# Altium project fmu_f405.PrjPcb
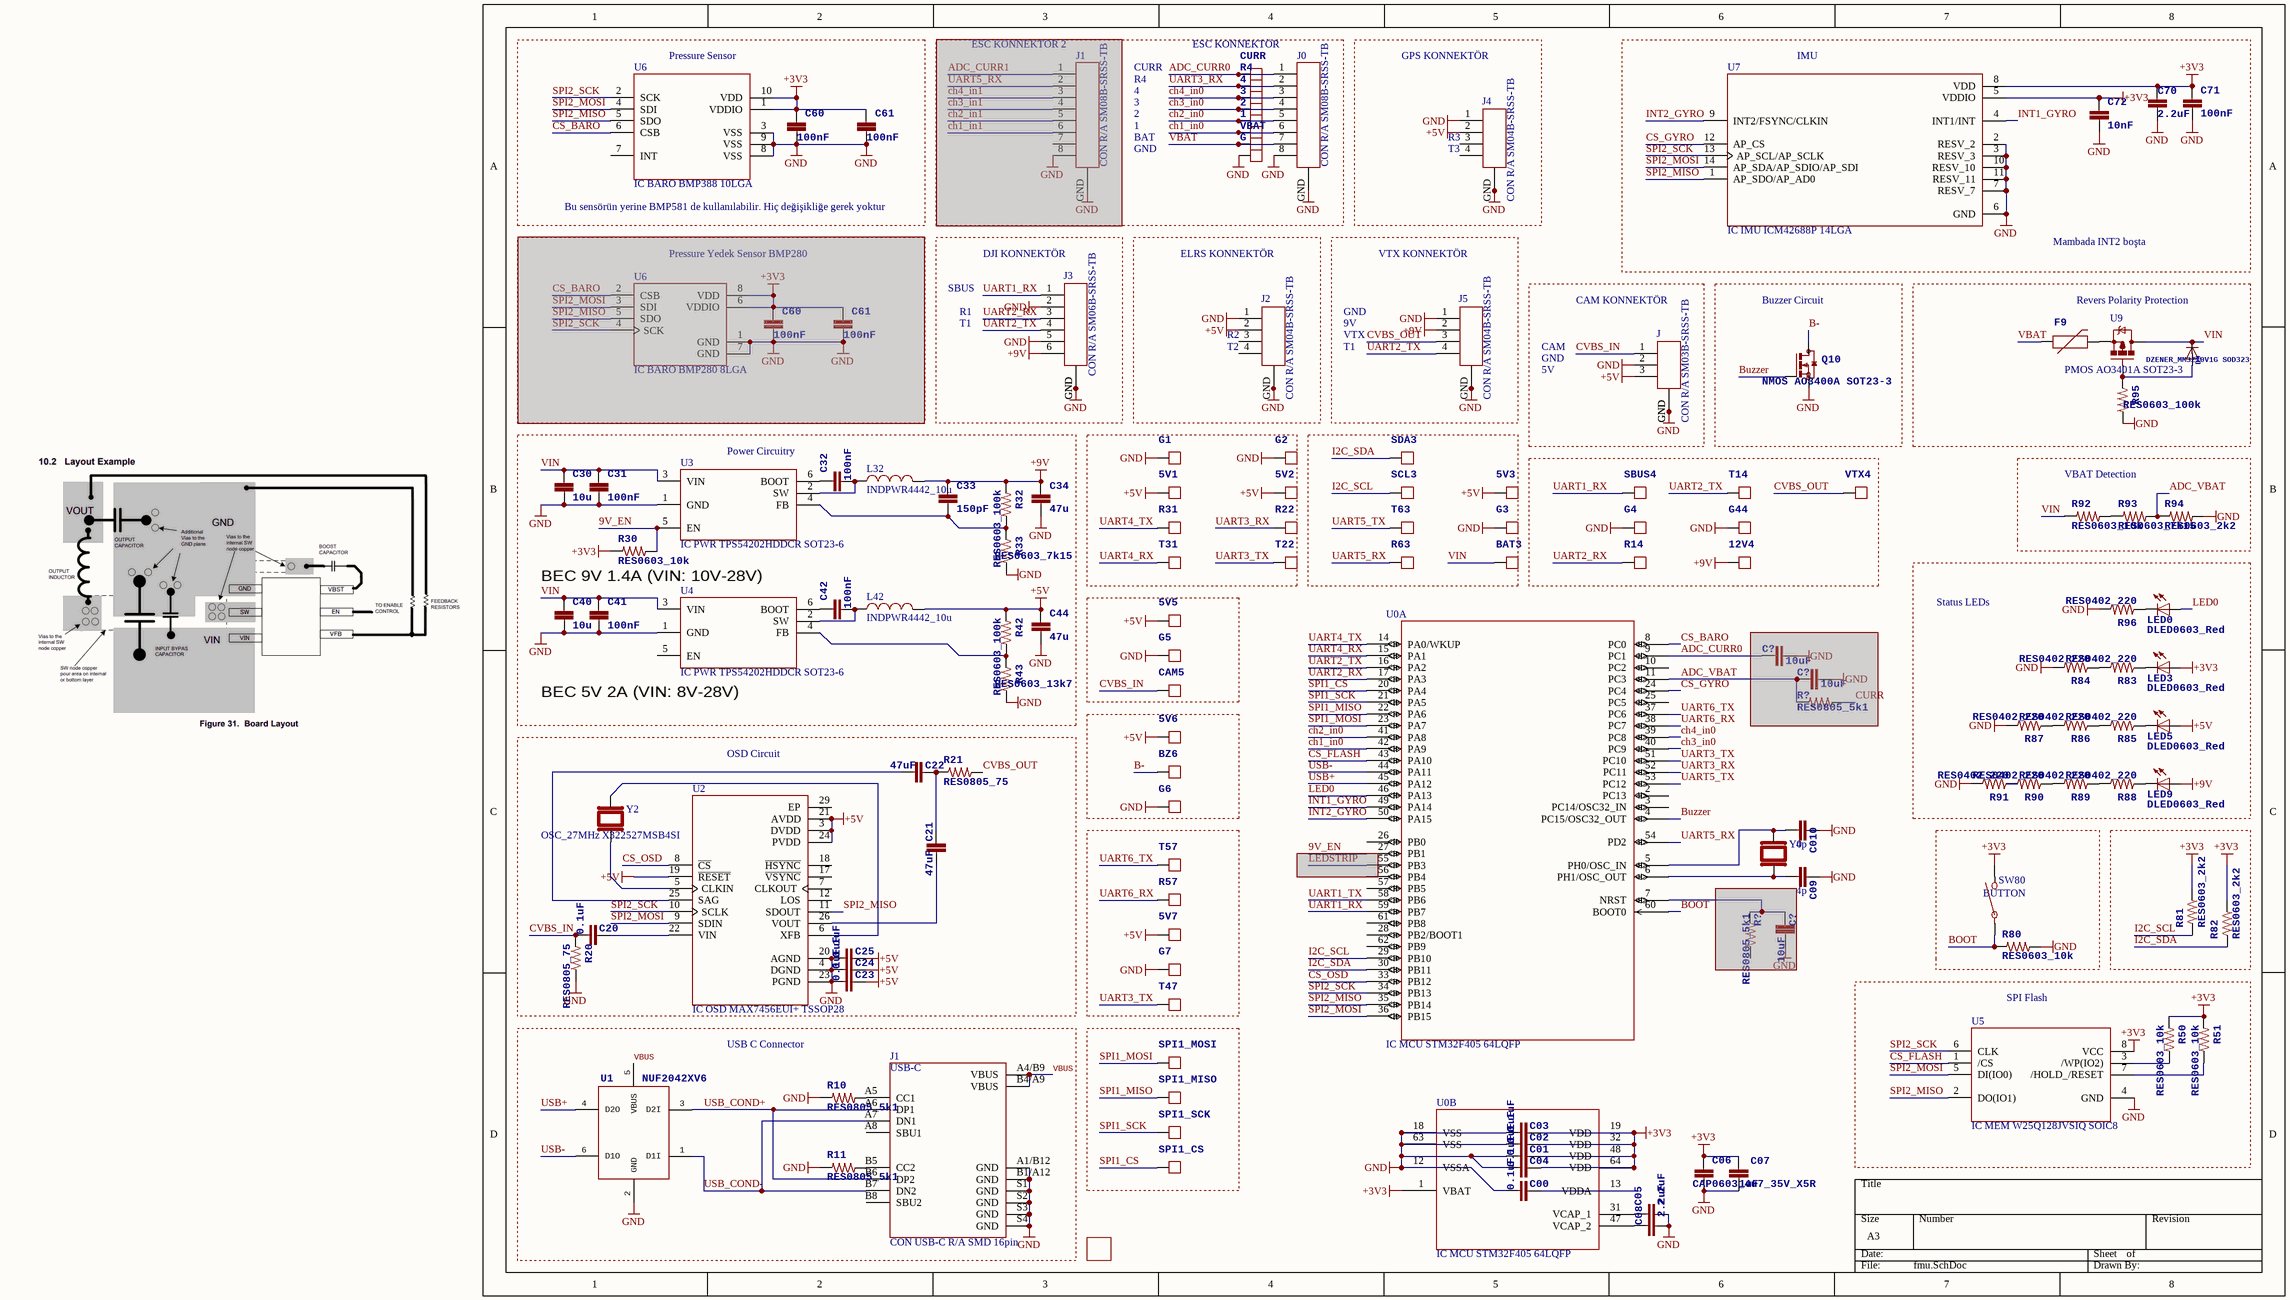
[diagram p0: fmu.SchDoc]
1 sheet, 142 parts. Net scope: global (net labels, ports and power ports of the same name join across sheets).

## Sheet fmu.SchDoc
size A3; SheetNumber: 1; SheetTotal: 1

### Parts
(Parts that share a designator on the sheet are numbered #1, #2 ... from top to bottom, then left to right.)
1  X PADR.12  [PAD.1X.15]  (value not drawn)  (no BOM)
2  X PADR.12  [PAD.1X.15]  (value not drawn)  (no BOM)
3  X PADR.12  [PAD.1X.15]  (value not drawn)  (no BOM)
4  X PADR.12  [PAD.1X.15]  (value not drawn)  (no BOM)
5V1  X PADR.12  [PAD.1X.15]  (value not drawn)  (no BOM)
5V2  X PADR.12  [PAD.1X.15]  (value not drawn)  (no BOM)
5V3  X PADR.12  [PAD.1X.15]  (value not drawn)  (no BOM)
5V5  X PADR.12  [PAD.1X.15]  (value not drawn)  (no BOM)
5V6  X PADR.12  [PAD.1X.15]  (value not drawn)  (no BOM)
5V7  X PADR.12  [PAD.1X.15]  (value not drawn)  (no BOM)
12V4  X PADR.12  [PAD.1X.15]  (value not drawn)  (no BOM)
BAT3  X PADR.12  [PAD.1X.15]  (value not drawn)  (no BOM)
BZ6  X PADR.12  [PAD.1X.15]  (value not drawn)  (no BOM)
C00  0.1uF  [0805-CAP]
C01  0.1uF  [0805-CAP]
C02  0.1uF  [0805-CAP]
C03  0.1uF  [0805-CAP]
C04  0.1uF  [0805-CAP]
C05  2.2uF  [0603-CAP]
C06  CAP0603_4u7_35V_X5R  [0603-CAP]
C07  1uF  [0805-CAP]
C08  2.2uF  [0603-CAP]
C09  4p  [0402-CAP]
C010  4p  [0402-CAP]
C20  0.1uF  [0805-CAP]
C21  47uF  [0805-CAP]
C22  47uF  [0805-CAP]
C23  0.1uF  [0805-CAP]
C24  0.1uF  [0805-CAP]
C25  0.1uF  [0805-CAP]
C30  10u  [1206-CAP]
C31  100nF  [0603-CAP]
C32  100nF  [0603-CAP]
C33  150pF  [0603-CAP]
C34  47u  [1206-CAP]
C40  10u  [1206-CAP]
C41  100nF  [0603-CAP]
C42  100nF  [0603-CAP]
C44  47u  [1206-CAP]
C60#1  100nF  [0603-CAP]
C60#2  100nF  [0603-CAP]  (masked out: inside a compile mask, not in the netlist)
C61#1  100nF  [0603-CAP]
C61#2  100nF  [0603-CAP]  (masked out: inside a compile mask, not in the netlist)
C70  2.2uF  [0805-CAP]
C71  100nF  [0603-CAP]
C72  10nF  [0603-CAP]
C?#1  10uF  [0805-CAP]  (masked out: inside a compile mask, not in the netlist)
C?#2  10uF  [0805-CAP]  (masked out: inside a compile mask, not in the netlist)
C?#3  10uF  [0805-CAP]  (masked out: inside a compile mask, not in the netlist)
CAM5  X PADR.12  [PAD.1X.15]  (value not drawn)  (no BOM)
CURR  X PADR.12  [PAD.1X.15]  (value not drawn)  (no BOM)
D9  DZENER_MM3Z10V1G SOD323  [SOD323]
F9  CFS12V3T5R0  [PTC-1206]  (value not drawn)
G  X PADR.12  [PAD.1X.15]  (value not drawn)  (no BOM)
G1  X PADR.12  [PAD.1X.15]  (value not drawn)  (no BOM)
G2  X PADR.12  [PAD.1X.15]  (value not drawn)  (no BOM)
G3  X PADR.12  [PAD.1X.15]  (value not drawn)  (no BOM)
G4  X PADR.12  [PAD.1X.15]  (value not drawn)  (no BOM)
G5  X PADR.12  [PAD.1X.15]  (value not drawn)  (no BOM)
G6  X PADR.12  [PAD.1X.15]  (value not drawn)  (no BOM)
G7  X PADR.12  [PAD.1X.15]  (value not drawn)  (no BOM)
G44  X PADR.12  [PAD.1X.15]  (value not drawn)  (no BOM)
J  CON R/A SM03B-SRSS-TB  [JST_SM03B-SRSS-TB]
J0  CON R/A SM08B-SRSS-TB  [JST_SM08B-SRSS-TB]
J1#1  CON R/A SM08B-SRSS-TB  [JST_SM08B-SRSS-TB]  (masked out: inside a compile mask, not in the netlist)
J1#2  CON USB-C R/A SMD 16pin  [GCT_USB4110GFA]
J2  CON R/A SM04B-SRSS-TB  [JST_SM04B-SRSS-TB]
J3  CON R/A SM06B-SRSS-TB  [JST_SM06B-SRSS-TB]
J4  CON R/A SM04B-SRSS-TB  [JST_SM04B-SRSS-TB]
J5  CON R/A SM04B-SRSS-TB  [JST_SM04B-SRSS-TB]
L32  INDPWR4442_10u  [4442-IND]
L42  INDPWR4442_10u  [4442-IND]
LED0  DLED0603_Red  [0603-LED]
LED3  DLED0603_Red  [0603-LED]
LED5  DLED0603_Red  [0603-LED]
LED9  DLED0603_Red  [0603-LED]
LOGO  00 LOGO FTECH  [00FTECH]  (value not drawn)  (no BOM)
Q10  NMOS AO3400A SOT23-3  [SOT23]
R4  X PADR.12  [PAD.1X.15]  (value not drawn)  (no BOM)
R10  RES0805_5k1  [0805-RES]
R11  RES0805_5k1  [0805-RES]
R14  X PADR.12  [PAD.1X.15]  (value not drawn)  (no BOM)
R20  RES0805_75  [0805-RES]
R21  RES0805_75  [0805-RES]
R22  X PADR.12  [PAD.1X.15]  (value not drawn)  (no BOM)
R30  RES0603_10k  [0603-RES]
R31  X PADR.12  [PAD.1X.15]  (value not drawn)  (no BOM)
R32  RES0603_100k  [0603-RES]
R33  RES0603_7k15  [0603-RES]
R42  RES0603_100k  [0603-RES]
R43  RES0603_13k7  [0603-RES]
R50  RES0603_10k  [0603-RES]
R51  RES0603_10k  [0603-RES]
R57  X PADR.12  [PAD.1X.15]  (value not drawn)  (no BOM)
R63  X PADR.12  [PAD.1X.15]  (value not drawn)  (no BOM)
R80  RES0603_10k  [0603-RES]
R81  RES0603_2k2  [0603-RES]
R82  RES0603_2k2  [0603-RES]
R83  RES0402_220  [0402-RES]
R84  RES0402_220  [0402-RES]
R85  RES0402_220  [0402-RES]
R86  RES0402_220  [0402-RES]
R87  RES0402_220  [0402-RES]
R88  RES0402_220  [0402-RES]
R89  RES0402_220  [0402-RES]
R90  RES0402_220  [0402-RES]
R91  RES0402_220  [0402-RES]
R92  RES0603_10k  [0603-RES]
R93  RES0603_7k15  [0603-RES]
R94  RES0603_2k2  [0603-RES]
R95  RES0603_100k  [0603-RES]
R96  RES0402_220  [0402-RES]
R?#1  RES0805_5k1  [0805-RES]  (masked out: inside a compile mask, not in the netlist)
R?#2  RES0805_5k1  [0805-RES]  (masked out: inside a compile mask, not in the netlist)
SBUS4  X PADR.12  [PAD.1X.15]  (value not drawn)  (no BOM)
SCL3  X PADR.12  [PAD.1X.15]  (value not drawn)  (no BOM)
SDA3  X PADR.12  [PAD.1X.15]  (value not drawn)  (no BOM)
SPI1_CS  X PADR.12  [PAD.1X.15]  (value not drawn)  (no BOM)
SPI1_MISO  X PADR.12  [PAD.1X.15]  (value not drawn)  (no BOM)
SPI1_MOSI  X PADR.12  [PAD.1X.15]  (value not drawn)  (no BOM)
SPI1_SCK  X PADR.12  [PAD.1X.15]  (value not drawn)  (no BOM)
SW80  SW TCTL TL3330AF260QG  [SW_TL3330]  (value not drawn)
T14  X PADR.12  [PAD.1X.15]  (value not drawn)  (no BOM)
T22  X PADR.12  [PAD.1X.15]  (value not drawn)  (no BOM)
T31  X PADR.12  [PAD.1X.15]  (value not drawn)  (no BOM)
T47  X PADR.12  [PAD.1X.15]  (value not drawn)  (no BOM)
T57  X PADR.12  [PAD.1X.15]  (value not drawn)  (no BOM)
T63  X PADR.12  [PAD.1X.15]  (value not drawn)  (no BOM)
U0  IC MCU STM32F405 64LQFP  [LQFP64-10x10mm]  (parts A,B of 2)
U1  NUF2042XV6  [SOT563-6]
U2  IC OSD MAX7456EUI+ TSSOP28  [TSSOP28]
U3  IC PWR TPS54202HDDCR SOT23-6  [SOT23-6]
U4  IC PWR TPS54202HDDCR SOT23-6  [SOT23-6]
U5  IC MEM W25Q128JVSIQ SOIC8  [SOIC8_208MIL]
U6#1  IC BARO BMP388 10LGA  [10LGA(2x2)]
U6#2  IC BARO BMP280 8LGA  [8LGA(2x2.5)]  (masked out: inside a compile mask, not in the netlist)
U7  IC IMU ICM42688P 14LGA  [14LGA(2.5x3)]
U9  PMOS AO3401A SOT23-3  [SOT23]
VBAT  X PADR.12  [PAD.1X.15]  (value not drawn)  (no BOM)
VTX4  X PADR.12  [PAD.1X.15]  (value not drawn)  (no BOM)
Y0  OSC_24MHz XRCGB24M000F3A00R0  [OSC_XRCGB24M000F3A00R0]  (value not drawn)
Y2  OSC_27MHz X322527MSB4SI  [SMD3225-4P]

### Blocks framed on the sheet
Pressure Sensor: C60#1 C61#1 U6#1
Pressure Yedek Sensor BMP280: C60#2 C61#2 U6#2
Buzzer Circuit: Q10
Revers Polarity Protection: D9 F9 R95 U9
VBAT Detection: R92-R94
Status LEDs: LED0 LED3 LED5 LED9 R83-R91 R96
OSD Circuit: C20-C25 R20 R21 U2 Y2
BUTTON: R80 SW80
SPI Flash: R50 R51 U5

### Nets
+3V3: C01.P$1 C02.P$1 C03.P$1 C04.P$1 C06.P$1 C07.P$1 C60#1.P$1 C61#1.P$1 C70.P$1 C71.P$1 C72.P$1 LED3.A R30.P$1 R50.P$1 R51.P$1 R81.P$2 R82.P$2 SW80.2 U0.1(VBAT) U0.19(VDD) U0.32(VDD) U0.48(VDD) U0.64(VDD) U5.8(VCC) U6#1.1(VDDIO) U6#1.10(VDD) U7.5(VDDIO) U7.8(VDD)
+5V: 5V1.P$1 5V2.P$1 5V3.P$1 5V5.P$1 5V6.P$1 5V7.P$1 C23.P$1 C24.P$1 C25.P$1 C44.P$1 J.3 J2.2 J4.2 L42.2 LED5.A R42.P$1 U2.3(DVDD) U2.19(~{RESET}) U2.21(AVDD) U2.24(PVDD)
+9V: 12V4.P$1 C33.P$1 C34.P$1 J3.6 J5.2 L32.2 LED9.A R32.P$1
GND: C00.P$2 C01.P$2 C02.P$2 C03.P$2 C04.P$2 C05.P$2 C06.P$2 C07.P$2 C08.P$2 C09.P$2 C010.P$2 C23.P$2 C24.P$2 C25.P$2 C30.P$2 C31.P$2 C34.P$2 C40.P$2 C41.P$2 C44.P$2 C60#1.P$2 C61#1.P$2 C70.P$2 C71.P$2 C72.P$2 G.P$1 G1.P$1 G2.P$1 G3.P$1 G4.P$1 G5.P$1 G6.P$1 G7.P$1 G44.P$1 J.2 J.GND J0.8 J0.GND J1#2.A1/B12(GND) J1#2.B1/A12(GND) J1#2.S1(GND) J1#2.S2(GND) J1#2.S3(GND) J1#2.S4(GND) J2.1 J2.GND J3.2 J3.5 J3.GND J4.1 J4.GND J5.1 J5.GND Q10.2(S) R10.P$1 R11.P$1 R20.P$2 R33.P$2 R43.P$2 R80.P$2 R84.P$2 R87.P$2 R91.P$2 R94.P$2 R95.P$2 R96.P$2 U0.12(VSSA) U0.18(VSS) U0.63(VSS) U1.2(GND) U2.4(DGND) U2.20(AGND) U2.23(PGND) U3.1(GND) U4.1(GND) U5.4(GND) U6#1.3(VSS) U6#1.8(VSS) U6#1.9(VSS) U7.2(RESV_2) U7.3(RESV_3) U7.6(GND) U7.7(RESV_7) U7.10(RESV_10) U7.11(RESV_11)
9V_EN: R30.P$2 U3.5(EN)
ADC_CURR0: CURR.P$1 J0.1 U0.9(PC1)
ADC_VBAT: R93.P$2 R94.P$1 U0.11(PC3)
B-: BZ6.P$1 Q10.3(D)
BOOT: R80.P$1 SW80.1 U0.60(BOOT0)
Buzzer: Q10.1(G) U0.4(PC15/OSC32_OUT)
ch1_in0: 1.P$1 J0.6 U0.42(PA9)
ch2_in0: 2.P$1 J0.5 U0.41(PA8)
ch3_in0: 3.P$1 J0.4 U0.40(PC9)
ch4_in0: 4.P$1 J0.3 U0.39(PC8)
CS_BARO: U0.8(PC0) U6#1.6(CSB)
CS_FLASH: U0.43(PA10) U5.1(/CS)
CS_GYRO: U0.24(PC4) U7.12(AP_CS)
CS_OSD: U0.33(PB12) U2.8(~{CS})
CVBS_IN: C20.P$2 CAM5.P$1 J.1 R20.P$1
CVBS_OUT: J5.3 R21.P$2 VTX4.P$1
I2C_SCL: R81.P$1 SCL3.P$1 U0.29(PB10)
I2C_SDA: R82.P$1 SDA3.P$1 U0.30(PB11)
INT1_GYRO: U0.49(PA14) U7.4(INT1/INT)
INT2_GYRO: U0.50(PA15) U7.9(INT2/FSYNC/CLKIN)
LED0: LED0.A U0.46(PA13)
SPI1_CS: SPI1_CS.P$1 U0.20(PA4)
SPI1_MISO: SPI1_MISO.P$1 U0.22(PA6)
SPI1_MOSI: SPI1_MOSI.P$1 U0.23(PA7)
SPI1_SCK: SPI1_SCK.P$1 U0.21(PA5)
SPI2_MISO: U0.35(PB14) U2.11(SDOUT) U5.2(DO(IO1)) U6#1.5(SDO) U7.1(AP_SDO/AP_AD0)
SPI2_MOSI: U0.36(PB15) U2.9(SDIN) U5.5(DI(IO0)) U6#1.4(SDI) U7.14(AP_SDA/AP_SDIO/AP_SDI)
SPI2_SCK: U0.34(PB13) U2.10(SCLK) U5.6(CLK) U6#1.2(SCK) U7.13(AP_SCL/AP_SCLK)
UART1_RX: J3.1 SBUS4.P$1 U0.59(PB7)
UART1_TX: U0.58(PB6)
UART2_RX: J3.3 R14.P$1 U0.17(PA3)
UART2_TX: J3.4 J5.4 T14.P$1 U0.16(PA2)
UART3_RX: J0.2 R4.P$1 R22.P$1 U0.52(PC11)
UART3_TX: T22.P$1 T47.P$1 U0.51(PC10)
UART4_RX: T31.P$1 U0.15(PA1)
UART4_TX: R31.P$1 U0.14(PA0/WKUP)
UART5_RX: R63.P$1 U0.54(PD2)
UART5_TX: T63.P$1 U0.53(PC12)
UART6_RX: R57.P$1 U0.38(PC7)
UART6_TX: T57.P$1 U0.37(PC6)
USB+: U0.45(PA12) U1.4(D2O)
USB-: U0.44(PA11) U1.6(D1O)
USB_COND+: J1#2.A6(DP1) J1#2.B6(DP2) U1.3(D2I)
USB_COND-: J1#2.A7(DN1) J1#2.B7(DN2) U1.1(D1I)
VBAT: F9.1 J0.7 VBAT.P$1
VBUS: J1#2.A4/B9(VBUS) J1#2.B4/A9(VBUS) U1.5(VBUS)
VIN: BAT3.P$1 C30.P$1 C31.P$1 C40.P$1 C41.P$1 D9.C R92.P$1 U3.3(VIN) U4.3(VIN) U9.3(D)
NetC00_P$1: C00.P$1 U0.13(VDDA)
NetC05_P$1: C05.P$1 U0.31(VCAP_1)
NetC08_P$1: C08.P$1 U0.47(VCAP_2)
NetC09_P$1: C09.P$1 U0.6(PH1/OSC_OUT) Y0.1
NetC010_P$1: C010.P$1 U0.5(PH0/OSC_IN) Y0.3
NetC20_P$1: C20.P$1 U2.22(VIN)
NetC21_P$1: C21.P$1 C22.P$1 R21.P$1
NetC21_P$2: C21.P$2 U2.26(VOUT)
NetC22_P$2: C22.P$2 U2.25(SAG)
NetC32_P$1: C32.P$1 U3.6(BOOT)
NetC32_P$2: C32.P$2 L32.1 U3.2(SW)
NetC33_P$2: C33.P$2 R32.P$2 R33.P$1 U3.4(FB)
NetC42_P$1: C42.P$1 U4.6(BOOT)
NetC42_P$2: C42.P$2 L42.1 U4.2(SW)
NetD9_A: D9.A R95.P$1 U9.1(G)
NetF9_2: F9.2 U9.2(S)
NetJ1#2_A5: J1#2.A5(CC1) R10.P$2
NetJ1#2_B5: J1#2.B5(CC2) R11.P$2
NetLED0_C: LED0.C R96.P$1
NetLED3_C: LED3.C R83.P$1
NetLED5_C: LED5.C R85.P$1
NetLED9_C: LED9.C R88.P$1
NetR42_P$2: R42.P$2 R43.P$1 U4.4(FB)
NetR50_P$2: R50.P$2 U5.3(/WP(IO2))
NetR51_P$2: R51.P$2 U5.7(/HOLD_/RESET)
NetR83_P$2: R83.P$2 R84.P$1
NetR85_P$2: R85.P$2 R86.P$1
NetR86_P$2: R86.P$2 R87.P$1
NetR88_P$2: R88.P$2 R89.P$1
NetR89_P$2: R89.P$2 R90.P$1
NetR90_P$2: R90.P$2 R91.P$1
NetR92_P$2: R92.P$2 R93.P$1
NetU2_5: U2.5(CLKIN) Y2.1
NetU2_6: U2.6(XFB) Y2.3

Not connected (* = marked no-connect by the designer): J1#2 A8(SBU1) B8(SBU2); J2 3 4; J4 3 4; U0 2(PC13) 3(PC14/OSC32_IN) 7(NRST) 10(PC2) 25(PC5) 26(PB0) 27(PB1) 28(PB2/BOOT1) 55(PB3) 56(PB4) 57(PB5) 61(PB8) 62(PB9); U2 7(CLKOUT) 12(LOS) 17(~{VSYNC}) 18(~{HSYNC}) 29(EP); U4 5(EN); U6#1 7(INT)

### Notes on the sheet
- (near J1#1) ESC KONNEKTÖR 2
- R4
- CURR
- 4
- ESC KONNEKTÖR
- GPS KONNEKTÖR
- (near U7) IMU
- 3
- 1
- 2
- GND
- BAT
- (near J4) R3
- (near J4) T3
- Bu sensörün yerine BMP581 de kullanılabilir. Hiç değişikliğe gerek yoktur
- (near J3) DJI KONNEKTÖR
- ELRS KONNEKTÖR
- VTX KONNEKTÖR
- Mambada INT2 boşta
- SBUS
- R1
- T1
- 9V
- CAM KONNEKTÖR
- (near J2) R2
- (near J2) T2
- VTX
- CAM
- 5V
- Power Circuitry
- BEC 9V 1.4A (VIN: 10V-28V)
- (near U4) BEC 5V 2A (VIN: 8V-28V)
- USB C Connector
- (near J1#2) USB-C

### Library data of the parts
C00 C01 C02 C03 C04 C20 C23-C25 = CAP0805_0u1: CAP CER 0.1UF 25V X7R 0805; Supplier Part Number 1: 1276-1099-1-ND; Manufacturer Product Number: *; Supplier Part Number 2: C519981; Value: 0.1uF; Voltage Rating: 25V
C05 C08 = CAP0603_2u2_10V_X7R: CAP CER 2.2uF 10V X7R ±10% 0603; Manufacturer Product Number: *; Supplier Part Number 1: *; Supplier Part Number 2: C100082; Package: 0603
C06 = CAP0603_4u7_35V_X5R: 35V 4.7uF X5R ±10% 0603 Multilayer Ceramic Capacitors MLCC - SMD/SMT ROHS; Value: 4.7u; Manufacturer Product Number: *; Supplier Part Number 1: *; Supplier Part Number 2: C162274; Package: 0603; Voltage Rating: 35V
C07 = CAP0805_1u: CAP CER 1UF 16V X7R 0805; Supplier Part Number 1: 311-1365-1-ND; Manufacturer Product Number: *; Supplier Part Number 2: C24123; Value: 1uF; Voltage Rating: 16V
C09 C010 = CAP0402_4p: CAP CER 4PF 50V C0G/NP0 0402; Voltage Rating: 50; Manufacturer Product Number: *; Supplier Part Number 1: 490-8100-1-ND; Supplier Part Number 2: C161323; Value: 4p
C21 C22 = CAP0805_47u: 10V 47uF X5R ±20% 0805 Multilayer Ceramic Capacitors MLCC - SMD/SMT ROHS; Manufacturer Product Number: GRM21BR61A476ME15L; Supplier Part Number 1: *; Supplier Part Number 2: C124129; Value: 47uF; Voltage Rating: 10V
C30 C40 = CAP1206_10u_50V_X5R: 50V 10uF X5R ±10% 1206 Multilayer Ceramic Capacitors MLCC - SMD/SMT ROHS; Manufacturer Product Number: CL31A106KBHNNNE; Supplier Part Number 2: C13585; Value: 10uF; Voltage Rating: 50V
C31 C32 C41 C42 C60#1 C60#2 C61#1 C61#2 C71 = CAP0603_100n_50V_X7R: 50V 100nF X7R ±10% 0603 Multilayer Ceramic Capacitors MLCC - SMD/SMT ROHS; Manufacturer Product Number: *; Supplier Part Number 1: *; Supplier Part Number 2: C14663; Package: 0603; Value: 100nF; Voltage Rating: 50V
C33 = CAP0603_150p_50V_X7R: 50V 150pF X7R ±10% 0603 Multilayer Ceramic Capacitors MLCC - SMD/SMT ROHS; Manufacturer Product Number: *; Supplier Part Number 1: *; Supplier Part Number 2: C1594; Package: 0603; Value: 150pF; Voltage Rating: 50V
C34 C44 = CAP1206_47u_10V_X5R: 10V 47uF X5R ±20% 1206 Multilayer Ceramic Capacitors MLCC - SMD/SMT ROHS; Manufacturer Product Number: *; Supplier Part Number 1: *; Supplier Part Number 2: C96123; Value: 47uF; Voltage Rating: 10V
C70 = CAP0805_2u2_25V_X7R: CAP CER 2.2UF 25V X7R 0805; Supplier Part Number 1: *; Manufacturer Product Number: *; Supplier Part Number 2: C19110; Value: 2.2uF; Voltage Rating: 25V; Package: 0805
C72 = CAP0603_10n_50V_X7R: X7R 50V 10nF ±10% 0603 Multilayer Ceramic Capacitors MLCC - SMD/SMT ROHS; Manufacturer Product Number: *; Supplier Part Number 1: *; Supplier Part Number 2: C100042; Package: 0603; Value: 10nF; Voltage Rating: 50V
C?#1-C?#3 = CAP0805_10u: CAPC,X5R,0805,10.00UF,10.00V,+/-10%; Voltage Rating: 10V; Supplier Part Number 1: 1276-2402-1-ND; Manufacturer Product Number: *; Supplier Part Number 2: C17024; Value: 10uF
D9 = DZENER_MM3Z10V1G SOD323: Independent Type 9.4V~10.6V 300mW 10V SOD-323 Zener Diodes ROHS; Manufacturer Product Number: MM3Z10VT1G; Value: 9.4V-10.6V; Package: SOD323; Supplier Part Number 1: MM3Z10VT1GOSCT-ND; Supplier Part Number 2: C39057
F9 = PTC1206_32V: 50A SMD Fuse 5A 32V 1206 Disposable fuses ROHS; Value: 5A; ComponentLink1Description: lcsc; ComponentLink1URL: https://www.lcsc.com/product-detail/Disposable-fuses_TA-I-Tech-CFS12V3T5R0_C163128.html?s_z=n_c163128; Supplier Part Number 2: C163128; Supplier Part Number 1: *; Manufacturer Product Number: CFS12V3T5R0
J = CON R/A SM03B-SRSS-TB: Connector Header Surface Mount, Right Angle 3 position 0.039 _1.00mm_; Manufacturer Product Number: SM03B-SRSS-TB; Supplier Part Number 1: 455-SM03B-SRSS-TBCT-ND; Supplier Part Number 2: C2763613
J0 J1#1 = CON R/A SM08B-SRSS-TB: SH Series 8 Position 1 mm Pitch Surface Mount Side Entry Shrouded Header Right Angle / CONN HEADER SMD R/A 8POS 1MM; Manufacturer Product Number: SM08B-SRSS-TB; Supplier Part Number 1: 455-1808-1-ND; Supplier Part Number 2: C2763618
J1#2 = CON USB-C R/A SMD 16pin: USB-C (USB TYPE-C) USB 2.0 Receptacle Connector 24 (16+8 Dummy) Position Surface Mount, Right Angle; Manufacturer Product Number: USB4110-GF-A; Supplier Part Number 1: 2073-USB4110-GF-A-1-ND; Supplier Part Number 2: C2840392
J2 J4 J5 = CON R/A SM04B-SRSS-TB: Connector Header Surface Mount, Right Angle 4 position 0.039 (1.00mm); Supplier Part Number 1: *; Supplier Part Number 2: C41431904; Manufacturer Product Number: SM04B-SRSS-TB
J3 = CON R/A SM06B-SRSS-TB: Connector Header Surface Mount, Right Angle 6 position 0.039 (1.00mm); Supplier Part Number 1: *; Supplier Part Number 2: C41431906; Manufacturer Product Number: SM06B-SRSS-TB
L32 L42 = INDPWR4442_10u: 1.6A 10uH Integrated molded inductor ±20% SMD,4.4x4.2x2mm Power Inductors ROHS; Manufacturer Product Number: YSPI0420-100M; Supplier Part Number 1: *; Supplier Part Number 2: C351093; Package: 4.4x4.2x2; Value: 10uH
LED0 LED3 LED5 LED9 = DLED0603_Red: Red LED Indication - Discrete 3.3V 0603; Supplier Part Number 2: C7371906
Q10 = NMOS AO3400A SOT23-3: N-Channel 30 V 5.7A (Ta) 1.4W (Ta) Surface Mount SOT-23-3; Manufacturer Product Number: AO3400A; Supplier Part Number 2: C20917; Supplier Part Number 1: 785-1000-1-ND
R10 R11 R?#1 R?#2 = RES0805_5k1: 125mW Thick Film Resistors ±5% ±200ppm/℃ 5.1kΩ 0805 Chip Resistor - Surface Mount ROHS; Value: 5.1k; Supplier Part Number 1: *; Manufacturer Product Number: *; Supplier Part Number 2: C230649; Voltage Rating: *; Package: 0805
R20 R21 = RES0805_75: 125mW Thick Film Resistors 150V ±100ppm/℃ ±1% 75Ω 0805 Chip Resistor - Surface Mount ROHS; Manufacturer Product Number: RC0805FR-0775RL; Value: 75; Supplier Part Number 1: *; Supplier Part Number 2: C141697; Voltage Rating: *; Package: 0805
R30 R50 R51 R80 R92 = RES0603_10k: 0.1W Thick Film Resistors 75V ±100ppm/℃ ±1% 10kΩ 0603 Chip Resistor - Surface Mount ROHS; Manufacturer Product Number: 0603WAF1002T5E; Value: 10k; Supplier Part Number 1: *; Supplier Part Number 2: C25804; Voltage Rating: *; Package: 0603
R32 R42 R95 = RES0603_100k: 0.1W Thick Film Resistors 75V ±100ppm/℃ ±1% 100kΩ 0603 Chip Resistor - Surface Mount ROHS; Manufacturer Product Number: 0603WAF1003T5E; Value: 100k; Supplier Part Number 1: *; Supplier Part Number 2: C25803; Voltage Rating: *; Package: 0603
R33 R93 = RES0603_7k15: 0.1W Thick Film Resistors 75V ±100ppm/℃ ±1% 7.15kΩ 0603 Chip Resistor - Surface Mount ROHS; Manufacturer Product Number: 0603WAF7151T5E; Value: 7.15k; Supplier Part Number 1: *; Supplier Part Number 2: C25980; Voltage Rating: *; Package: 0603
R43 = RES0603_13k7: 0.1W Thick Film Resistors 75V ±100ppm/℃ ±1% 13.7kΩ 0603 Chip Resistor - Surface Mount ROHS; Manufacturer Product Number: 0603WAF1372T5E; Value: 13.7k; Supplier Part Number 1: *; Supplier Part Number 2: C22793; Voltage Rating: *; Package: 0603
R81 R82 R94 = RES0603_2k2: 75V 2.2kΩ Thick Film Resistors 100mW ±1% ±100ppm/℃ 0603 Chip Resistor - Surface Mount ROHS; Value: 2.2k; Supplier Part Number 1: *; Manufacturer Product Number: *; Supplier Part Number 2: C4190; Voltage Rating: *; Package: 0603
R83-R91 R96 = RES0402_220: 62.5mW Thick Film Resistors 50V ±100ppm/℃ ±1% 220Ω 0402 Chip Resistor - Surface Mount ROHS; Value: 220; Supplier Part Number 1: *; Manufacturer Product Number: *; Supplier Part Number 2: C112291; Package: 0402
SW80 = SW TCTL TL3330AF260QG: 1.8mm 3.5mm Rectangle button 50mA Horizontal attachment 4.55mm SPST 12V SMD Tactile Switches ROHS; Manufacturer Product Number: TS24CA; Supplier Part Number 1: C42420270; Supplier Part Number 2: C5373430
U0 = IC MCU STM32F405 64LQFP: IC MCU 32BIT 1MB FLASH 64LQFP; Manufacturer Product Number: STM32F405RGT6; Supplier Part Number 1: 497-11767-ND; Supplier Part Number 2: C15742
U1 = IC USB NUF2042XV6 SOT563: IC FILTER USB ESD PROTECT SOT563; Manufacturer Product Number: NUF2042XV6T1G; Supplier Part Number 2: C90707; Package: SOT563; Supplier Part Number 1: NUF2042XV6T1GOSDKR-ND
U2 = IC OSD MAX7456EUI+ TSSOP28: Video - IC Serial, SPI NTSC, PAL 28-TSSOP-EP Package; Package: TSSOP-28; Manufacturer Product Number: MAX7456EUI; Supplier Part Number 1: *; Supplier Part Number 2: C82351
U3 U4 = IC PWR TPS54202HDDCR SOT23-6: 4.5V to 28V Input, 2A Output, Synchronous Step-Down Voltage Converter 6-SOT-23-THIN -40 to 125; Manufacturer Product Number: TPS54202HDDCR; Supplier Part Number 1: *; Supplier Part Number 2: C191884; Package: SOT23-6
U5 = IC MEM W25Q128JVSIQ SOIC8: SPI 133MHz SOIC-8-208mil NOR FLASH ROHS; Package: SOIC8; Manufacturer Product Number: *; Supplier Part Number 1: *; Supplier Part Number 2: *
U6#1 = IC BARO BMP388 10LGA: Pressure Sensor 4.35PSI ~ 18.13PSI (30kPa ~ 125kPa) Absolute 10-WFLGA; Manufacturer Product Number: BMP388; Supplier Part Number 1: 828-1079-1-ND; Supplier Part Number 2: C779278; Package: 10LGA
U6#2 = IC BARO BMP280 8LGA: BMP280 Absolute Barometric Pressure Sensor for Battery Powered Devices 2 x 2.5mm; Package: None; Availability: Unavailable; MP: BMP280; Value: *; Price: None
U7 = IC IMU ICM42688P 14LGA: Accelerometer gyroscope LGA-14(2.5x3) Accelerometers ROHS; Manufacturer Product Number: ICM-42688-P; Package: 14LGA(2.5x3); Supplier Part Number 1: 1428-ICM-42688-PCT-ND; Supplier Part Number 2: C1850418
U9 = PMOS AO3401A SOT23-3: P-Channel 30 V 4A (Ta) 1.4W (Ta) Surface Mount SOT-23-3; Suplier Part Number 1: 785-1001-1-ND; Suplier Part Number 2: C15127; Value: 30V 4A; Manufacturer Product Number: AO3401A; Package: SOT23-3
Y0 = OSC_24MHz XRCGB24M000F3A00R0: CRYSTAL 24.0000MHZ 6PF SMD ±30ppm Crystal 6pF 120 Ohms 4-SMD, No Lead; Supplier Part Number 2: C194420; Manufacturer Product Number: XRCGB24M000F3A00R0; Supplier Part Number 1: 490-12145-1-ND
Y2 = OSC_27MHz X322527MSB4SI: 27MHz Surface Mount Crystal 20pF ±10ppm ±20ppm SMD3225-4P Crystals ROHS; Supplier Part Number 2: C9008; Manufacturer Product Number: X322527MSB4SI; Supplier Part Number 1: *